# Altium schematic sheet VFD-Support-Sheet.SchDoc (part 3 of 3)
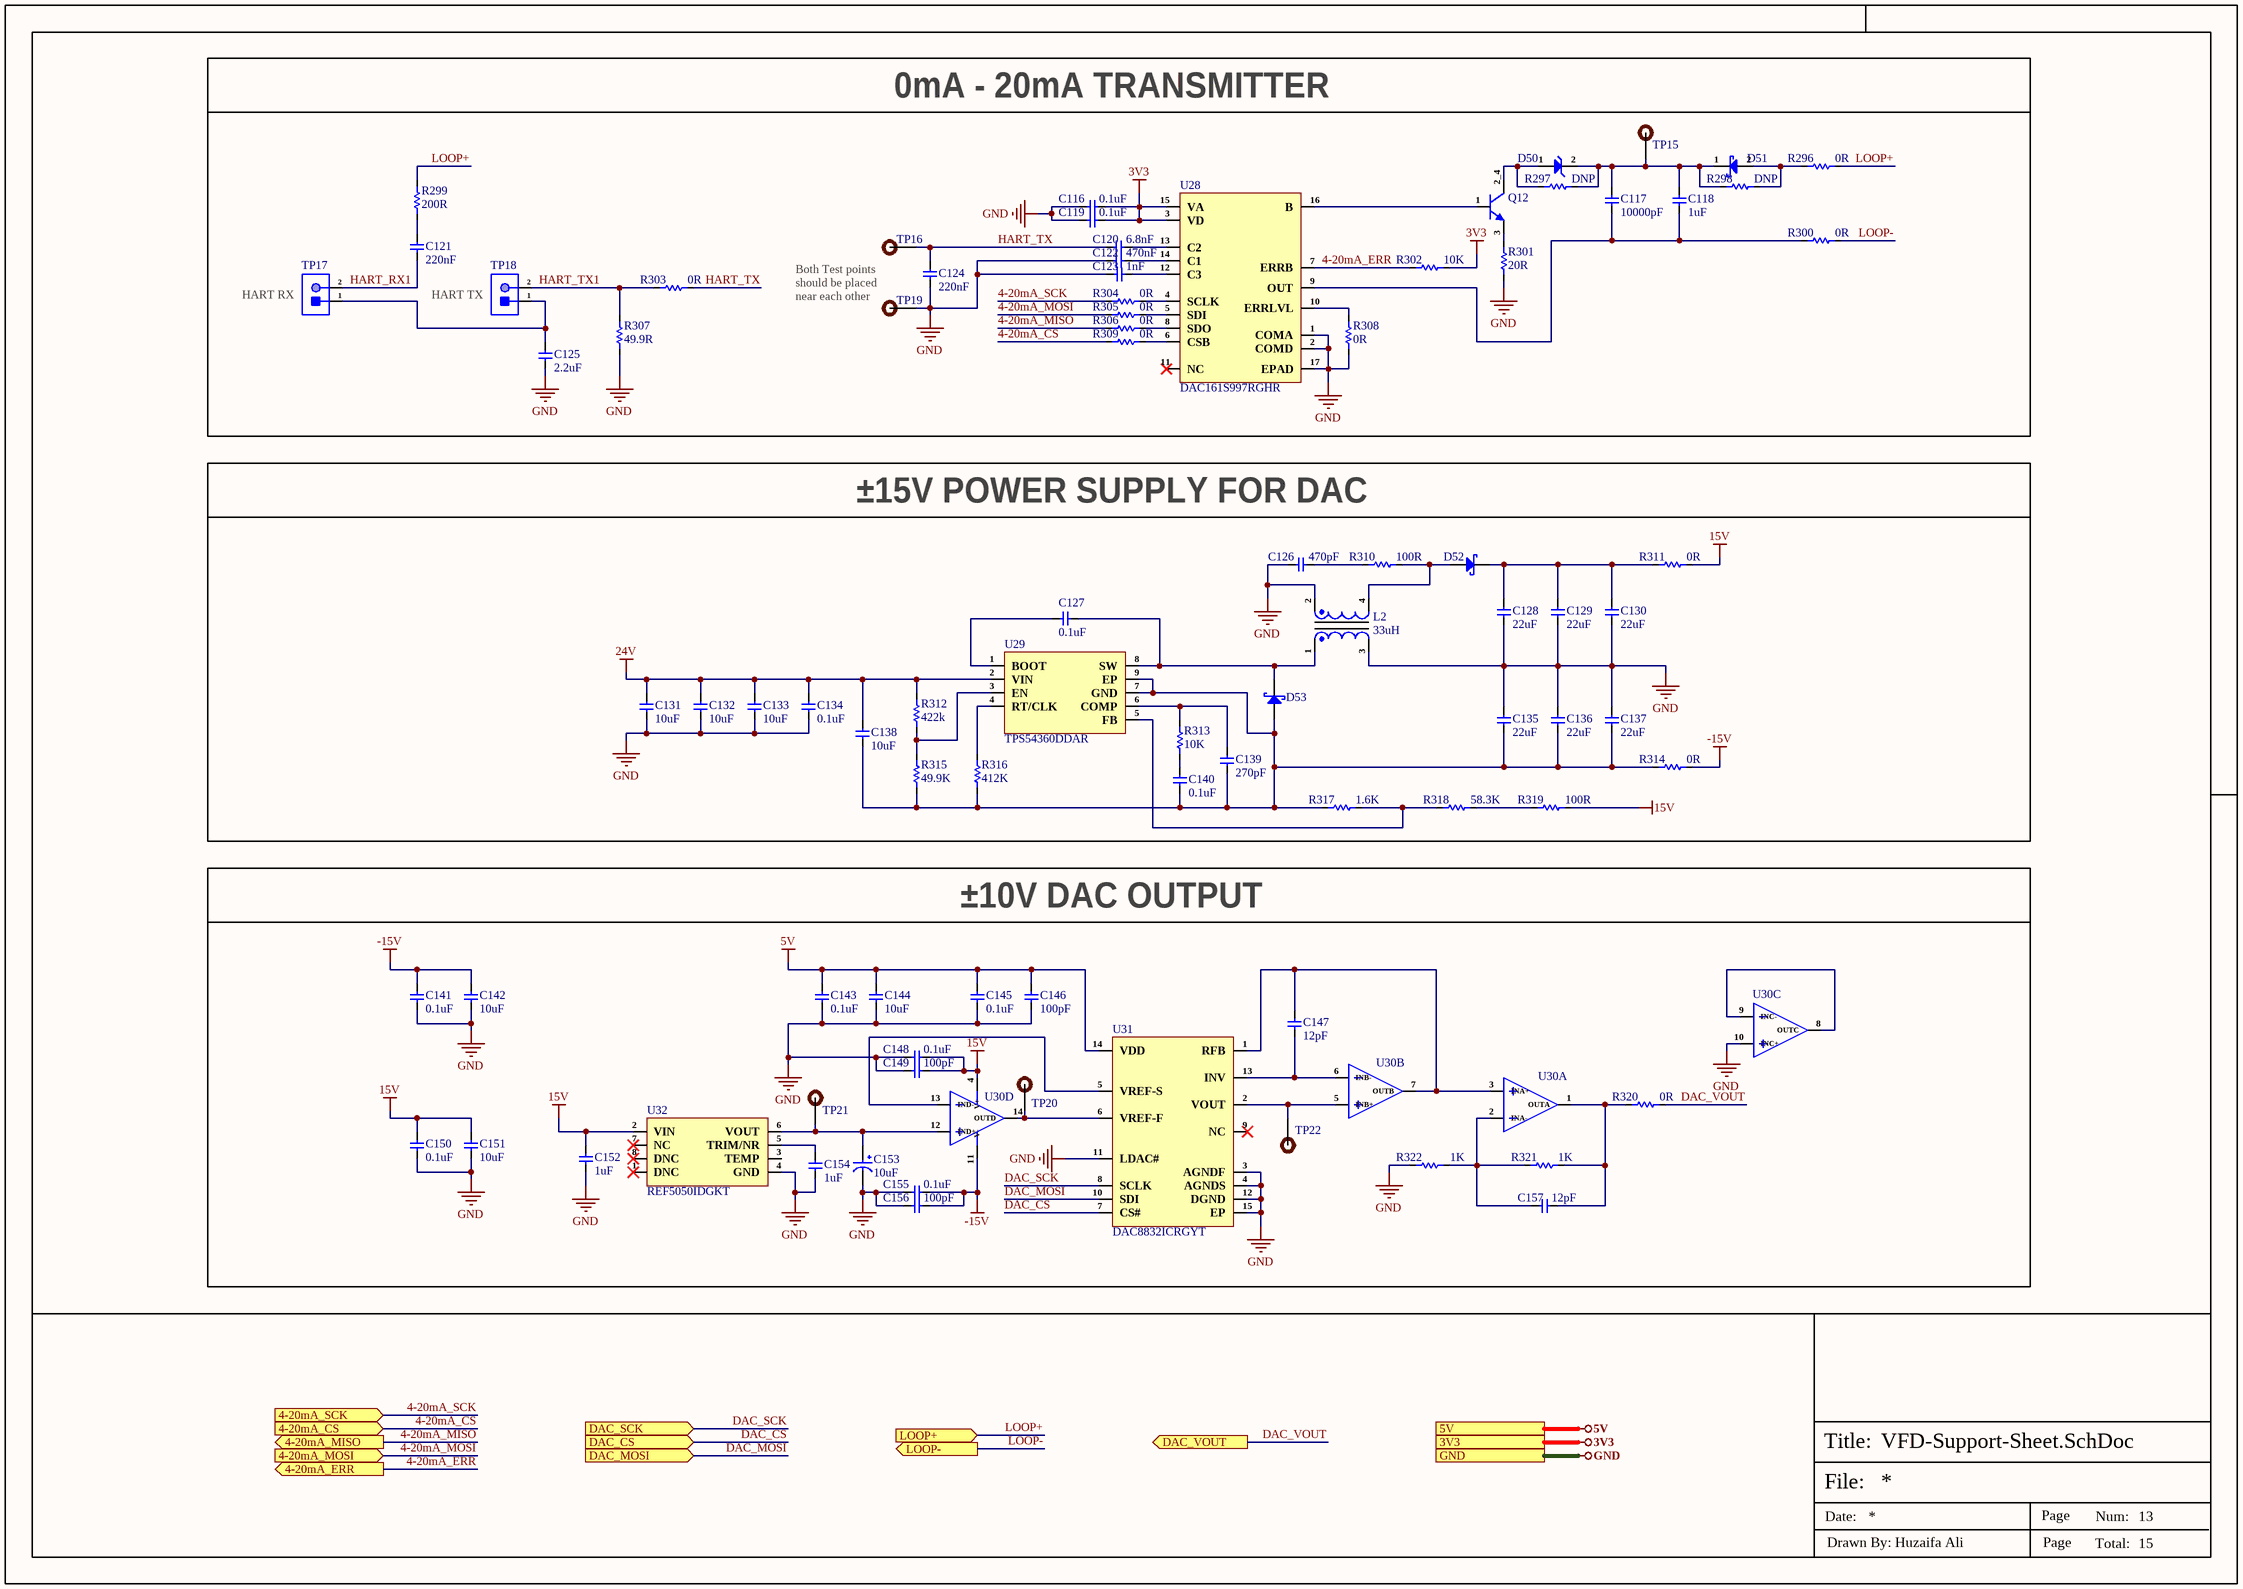
[diagram p2: VFD-Support-Sheet.SchDoc]

## Library data of the parts (continued)
R312 = RT0805BRD07422KL: RES SMD 422K OHM 0.1% 1/8W 0805; Manufacturer: Yageo; Voltage Rating: 150V; Value: 422kR; Power Rating: 125mW; Temperature Coefficient: 25ppm/°C; Item Type: Resistor; Supplier 1: Digi-Key; Manufacturer Part Number: RT0805BRD07422KL; RoHS: Yes; Category: Chip SMD Resistors; Stock 1: 2917; Pricing 1: 1=0.38, 10=0.272, 100=0.1087, 500=0.07404, 1000=0.05357, 2500=0.04963 (USD); Case/Package: 0805; Case Code (Metric): 2012; Case Code (Imperial): 0805; Min Operating Temperature: -55°C; Max Operating Temperature: 155°C; Tolerance: 0.1%; Packaging: Tape and Reel; Termination: SMD/SMT; Voltage Rating (DC): 150V; Series: RT; Max Power Dissipation: 125mW; Number of Terminations: 2; Length: 2mm; Width: 1.25mm; Height: 500um; Lead Free: Lead Free; RoHS Compliant: Yes; ComponentLink1URL: https://datasheet.ciiva.com/12704/pyu-rt-1-to-0-05-rohs-l-4-12704463.pdf?src-supplier=Mouser; ComponentLink1Description: https://datasheet.ciiva.com/12704/pyu-rt-1-to-0-05-rohs-l-4-12704463.pdf?src-supplier=Mouser; Supplier Part Number 1: YAG4899CT-ND; LCSC Part Number: C865483
R315 = RC0805FR-0749K9L: RES 49.9K OHM 1% 1/8W 0805; Manufacturer: Yageo; Item Type: Resistor; Supplier: Future Electronics; Supplier Part Number: 3813284; Manufacturer Part Number: RC0805FR-0749K9L; RoHS: Yes; Category: Chip SMD Resistors; Stock: 665000; Pricing: 5000=0.0041, 25000=0.0025, 50000=0.0038, 125000=0.0024, 200000=0.0036, 500000=0.0023, 625000=0.0035, 1250000=0.0021, 2000000=0.0032 (USD); ComponentLink1URL: https://datasheet.ciiva.com/11808/0900766b8106beab-11808911.pdf?src-supplier=Rs; ComponentLink1Description: https://datasheet.ciiva.com/11808/0900766b8106beab-11808911.pdf?src-supplier=Rs; ComponentLink2URL: https://datasheet.ciiva.com/12656/rc0805-12656764.pdf?src-supplier=Mouser; ComponentLink2Description: https://datasheet.ciiva.com/12656/rc0805-12656764.pdf?src-supplier=Mouser; ComponentLink3URL: https://datasheet.ciiva.com/2456/pyu-r-int-thick-7-2456990.pdf?src-supplier=Digi-Key; ComponentLink3Description: https://datasheet.ciiva.com/2456/pyu-r-int-thick-7-2456990.pdf?src-supplier=Digi-Key; ComponentLink4URL: https://datasheet.ciiva.com/2456/pyu-r-int-thick-7-2456991.pdf?src-supplier=Digi-Key; ComponentLink4Description: https://datasheet.ciiva.com/2456/pyu-r-int-thick-7-2456991.pdf?src-supplier=Digi-Key; ComponentLink5URL: https://datasheet.ciiva.com/2456/pyu-r-int-thick-7-2456992.pdf?src-supplier=Digi-Key; ComponentLink5Description: https://datasheet.ciiva.com/2456/pyu-r-int-thick-7-2456992.pdf?src-supplier=Digi-Key; LCSC Part Number: C114540
R316 = RT0805BRD07412KL: RES SMD 412K OHM 0.1% 1/8W 0805; Manufacturer: Yageo; Item Type: Resistors; Value: 412kR; Power Rating: 125mW; Voltage Rating: 150V; Temperature Coefficient: 25ppm/°C; Supplier: Mouser; LCSC Part Number: C865478; Manufacturer Part Number: RT0805BRD07412KL; RoHS: Yes; Stock: 5000; Pricing: 1=0.16, 10=0.121, 50=0.095, 100=0.085, 1000=0.057, 10000=0.038 (USD); Case/Package: 0805; Case Code (Imperial): 0805; Case Code (Metric): 2012; Weight: 0.000194oz; Min Operating Temperature: -55°C; Max Operating Temperature: 155°C; Packaging: Tape and Reel; Tolerance: 0.1%; Termination: SMD/SMT; Voltage Rating (DC): 150V; Series: RT; Max Power Dissipation: 125mW; Number of Terminations: 2; Length: 2mm; Width: 1.2mm; Height: 0.5mm; Lead Free: Lead Free; RoHS Compliant: Yes; ComponentLink1URL: http://www.mouser.com/ds/2/447/yageodocoutput-1125656.pdf?src-supplier=Mouser; ComponentLink1Description: http://www.mouser.com/ds/2/447/yageodocoutput-1125656.pdf?src-supplier=Mouser; ComponentLink2URL: http://www.yageo.com/documents/recent/PYu-RT_1-to-0.01_RoHS_L_9.pdf?src-supplier=Digikey; ComponentLink2Description: http://www.yageo.com/documents/recent/PYu-RT_1-to-0.01_RoHS_L_9.pdf?src-supplier=Digikey
R317 = RT0402BRD071K6L: RES SMD 1.6K OHM 0.1% 1/16W 0402; Manufacturer: Yageo; Resistance: 1.6kR; Power Rating: 62.5mW; Voltage Rating: 50V; Temperature Coefficient: 25ppm/°C; Max Power Dissipation: 63mW; Item Type: Resistor; Supplier 1: Digi-Key; Manufacturer Part Number: RT0402BRD071K6L; RoHS: Yes; Category: Chip SMD Resistors; Stock 1: 20555; Pricing 1: 1=0.40000, 10=0.33600, 100=0.13130, 500=0.07938, 1000=0.05496, 2500=0.05038, 5000=0.04580 (USD); Case/Package: 0402; Case Code (Imperial): 0402; Case Code (Metric): 1005; Weight: 2.3E-05oz; Min Operating Temperature: -55°C; Max Operating Temperature: 125°C; Packaging: Tape and Reel; Tolerance: 0.1%; Package Quantity: 10000; Resistor Type: Thin Film; Termination: SMD/SMT; Number of Terminations: 2; Voltage Rating (DC): 50V; Series: RT; Length: 0.039inch; Width: 0.5mm; Height: 0.014inch; Lead Free: Lead Free; RoHS Compliant: Yes; ComponentLink1URL: https://datasheet.ciiva.com/2582/pyu-rt-1-to-0-05-rohs-l-5-2582211.pdf?src-supplier=Digi-Key; ComponentLink1Description: https://datasheet.ciiva.com/2582/pyu-rt-1-to-0-05-rohs-l-5-2582211.pdf?src-supplier=Digi-Key; LCSC Part Number: C852616; Supplier Part Number 1: YAG4199CT-ND
R318 = RT0402BRD0758K3L: RES SMD 58.3KOHM 0.1% 1/16W 0402; Manufacturer: Yageo; Item Type: Resistors; Supplier: Mouser; LCSC Part Number: C852851; Manufacturer Part Number: RT0402BRD0758K3L; RoHS: Yes; Stock: 10000; Pricing: 1=0.16, 10=0.121, 50=0.096, 100=0.086, 1000=0.057, 10000=0.038 (USD); ComponentLink1URL: https://datasheet.octopart.com/RT0402BRD0758K3L-Yageo-datasheet-164439670.pdf?src-supplier=Newark; ComponentLink1Description: https://datasheet.octopart.com/RT0402BRD0758K3L-Yageo-datasheet-164439670.pdf?src-supplier=Newark; ComponentLink2URL: http://www.yageo.com/documents/recent/PYu-RT_1-to-0.01_RoHS_L_9.pdf?src-supplier=Digikey; ComponentLink2Description: http://www.yageo.com/documents/recent/PYu-RT_1-to-0.01_RoHS_L_9.pdf?src-supplier=Digikey; ComponentLink3URL: https://www.yageo.com/upload/media/product/productsearch/datasheet/rchip/PYu-RT_1-to-0.01_RoHS_L_12.pdf?src-supplier=Digikey; ComponentLink3Description: https://www.yageo.com/upload/media/product/productsearch/datasheet/rchip/PYu-RT_1-to-0.01_RoHS_L_12.pdf?src-supplier=Digikey; ComponentLink4URL: https://datasheet.octopart.com/RT0402BRD0758K3L-Yageo-datasheet-166250672.pdf?src-supplier=Future+Electronics; ComponentLink4Description: https://datasheet.octopart.com/RT0402BRD0758K3L-Yageo-datasheet-166250672.pdf?src-supplier=Future+Electronics
R321 R322 = RC0402FR-071KL: RES 1K OHM 1% 1/16W 0402; Manufacturer: Yageo; Resistance: 1kR; Temperature Coefficient: 100ppm/°C; Voltage Rating (DC): 50V; Power Rating: 62.5mW; Max Power Dissipation: 63mW; Item Type: Resistor; Supplier 1: Avnet; Manufacturer Part Number: RC0402FR-071KL; RoHS: Yes; Category: Chip SMD Resistors; Stock 1: 13030000; Pricing 1: 10000=0.00085, 20000=0.00087, 40000=0.00084, 60000=0.00083, 80000=0.00079, 100000=0.00078, 1000000=0.00076 (USD); Case/Package: 0402; Number of Pins: 2; Case Code (Imperial): 0402; Case Code (Metric): 1005; Size Code: 0402; Min Operating Temperature: -55°C; Max Operating Temperature: 155°C; Resistor Type: Thick Film; Tolerance: 1%; Packaging: Tape and Reel; Voltage Rating: 50V; Termination: SMD/SMT; Features: Moisture Resistant; Series: RC; Number of Terminations: 2; Resistance Tolerance: 1%; Construction: Rectangular; Technology: THICK FILM; Length: 1mm; Width: 0.5mm; Height: 0.32mm; Depth: 0.5mm; Reach SVHC Compliant: Yes; Lead Free: Lead Free; RoHS Compliant: Yes; Military Standard: Not; ComponentLink1URL: https://datasheet.ciiva.com/11819/0900766b80c66297-11819477.pdf?src-supplier=RSComponents; ComponentLink1Description: https://datasheet.ciiva.com/11819/0900766b80c66297-11819477.pdf?src-supplier=RSComponents; ComponentLink2URL: https://datasheet.ciiva.com/7983/1018594-7983502.pdf?src-supplier=Element14; ComponentLink2Description: https://datasheet.ciiva.com/7983/1018594-7983502.pdf?src-supplier=Element14; ComponentLink3URL: https://datasheet.ciiva.com/22747/1018594-22747513.pdf?src-supplier=Element14; ComponentLink3Description: https://datasheet.ciiva.com/22747/1018594-22747513.pdf?src-supplier=Element14; ComponentLink4URL: https://datasheet.ciiva.com/12666/pyu-rc0402-51-rohs-l-6-r-12666741.pdf?src-supplier=Mouser; ComponentLink4Description: https://datasheet.ciiva.com/12666/pyu-rc0402-51-rohs-l-6-r-12666741.pdf?src-supplier=Mouser; ComponentLink5URL: https://datasheet.ciiva.com/7849/1018594-7849869.pdf?src-supplier=Element14; ComponentLink5Description: https://datasheet.ciiva.com/7849/1018594-7849869.pdf?src-supplier=Element14; ComponentLink6URL: https://datasheet.ciiva.com/7849/1018594-7849871.pdf?src-supplier=Element14; ComponentLink6Description: https://datasheet.ciiva.com/7849/1018594-7849871.pdf?src-supplier=Element14; ComponentLink7URL: https://datasheet.ciiva.com/17063/pyu-rc0402-51-rohs-l-6-r-17063193.pdf?src-supplier=Future+Electronics; ComponentLink7Description: https://datasheet.ciiva.com/17063/pyu-rc0402-51-rohs-l-6-r-17063193.pdf?src-supplier=Future+Electronics; Supplier Part Number 1: RC0402FR-071KL; LCSC Part Number: C106235
TP15 TP16 TP19-TP22 = TEST POINT: Test Point ON; Item Type: TEST POINT
TP17 TP18 = 2 Test Pad: Wire Connecting Pad; Item Type: Test Point; Manufacturer Part Number: 2 Test Pad
U28 = DAC161S997RGHR: IC DAC 16BIT 16WQFN; Manufacturer: Texas Instruments; Supplier: Mouser; LCSC Part Number: C90500; Manufacturer Part Number: DAC161S997RGHR; RoHS: Yes; Item Type: IC; Stock: 4693; Pricing: 1=5.54, 10=4.08, 50=4.08, 100=3.71, 1000=3.03, 10000=2.74 (USD); ComponentLink1URL: https://datasheet.ciiva.com/18633/dac161s997-18633093.pdf?src-supplier=Digikey; ComponentLink1Description: https://datasheet.ciiva.com/18633/dac161s997-18633093.pdf?src-supplier=Digikey; ComponentLink2URL: https://datasheet.ciiva.com/29897/dac161s997-29897307.pdf?src-supplier=Avnet; ComponentLink2Description: https://datasheet.ciiva.com/29897/dac161s997-29897307.pdf?src-supplier=Avnet
U29 = TPS54360DDAR: IC REG BCK SPLIT RAIL ADJ 8SOPWR; Manufacturer: Texas Instruments; Supplier: Mouser; LCSC Part Number: C44377; Manufacturer Part Number: TPS54360DDAR; RoHS: Yes; Item Type: IC; Stock: 2440; Pricing: 1=4.37, 10=3.05, 50=3.05, 100=2.76, 1000=2.47, 10000=2.31 (USD); ComponentLink1URL: https://datasheet.ciiva.com/12221/tps54360-109421-12221526.pdf?src-supplier=Mouser; ComponentLink1Description: https://datasheet.ciiva.com/12221/tps54360-109421-12221526.pdf?src-supplier=Mouser; ComponentLink2URL: https://datasheet.ciiva.com/14833/2976tps54360-14833745.pdf?src-supplier=Arrow+Electronics; ComponentLink2Description: https://datasheet.ciiva.com/14833/2976tps54360-14833745.pdf?src-supplier=Arrow+Electronics; ComponentLink3URL: https://datasheet.ciiva.com/14377/tps54360-14377976.pdf?src-supplier=Avnet; ComponentLink3Description: https://datasheet.ciiva.com/14377/tps54360-14377976.pdf?src-supplier=Avnet; ComponentLink4URL: https://datasheet.ciiva.com/41798/tps54360-41798794.pdf?src-supplier=Digikey; ComponentLink4Description: https://datasheet.ciiva.com/41798/tps54360-41798794.pdf?src-supplier=Digikey
U30 = OPA4192IPWR: IC OPAMP GP 4 CIRCUIT 14TSSOP; Manufacturer: Texas Instruments; Supplier: Mouser; LCSC Part Number: C2057935; Manufacturer Part Number: OPA4192IPWR; RoHS: Yes; Item Type: IC; Stock: 4607; Pricing: 1=6.33, 10=4.87, 50=4.5, 100=4.1, 1000=3.67, 10000=3.59 (USD); ComponentLink1URL: http://www.ti.com/general/docs/suppproductinfo.tsp?distId=10&amp;gotoUrl=http%3A%2F%2Fwww.ti.com%2Flit%2Fgpn%2Fopa4192&src-supplier=Digikey; ComponentLink1Description: http://www.ti.com/general/docs/suppproductinfo.tsp?distId=10&amp;gotoUrl=http%3A%2F%2Fwww.ti.com%2Flit%2Fgpn%2Fopa4192&src-supplier=Digikey; ComponentLink2URL: http://www.ti.com/lit/gpn/opa4192?src-supplier=Mouser; ComponentLink2Description: http://www.ti.com/lit/gpn/opa4192?src-supplier=Mouser
U31 = DAC8832ICRGYT: IC DAC 16BIT V-OUT 14VQFN; Manufacturer: Texas Instruments; Supplier: Mouser; LCSC Part Number: C2876764; Manufacturer Part Number: DAC8832ICRGYT; RoHS: Yes; Item Type: IC; Stock: 307; Pricing: 1=16.19, 10=12.83, 50=11.99, 100=11.06, 1000=10.23, 10000=10.23 (USD); ComponentLink1URL: https://datasheet.ciiva.com/12285/sbas380b-190797-12285552.pdf?src-supplier=Mouser; ComponentLink1Description: https://datasheet.ciiva.com/12285/sbas380b-190797-12285552.pdf?src-supplier=Mouser; ComponentLink2URL: https://datasheet.ciiva.com/15147/getdatasheetpartid-247745-15147072.pdf?src-supplier=Verical; ComponentLink2Description: https://datasheet.ciiva.com/15147/getdatasheetpartid-247745-15147072.pdf?src-supplier=Verical; ComponentLink3URL: https://datasheet.ciiva.com/41460/001186155-da-01-en-ic-dac-16bit-vo-dac8832icrgyt-qfn-14-tid-41460090.pdf?src-supplier=Conrad; ComponentLink3Description: https://datasheet.ciiva.com/41460/001186155-da-01-en-ic-dac-16bit-vo-dac8832icrgyt-qfn-14-tid-41460090.pdf?src-supplier=Conrad; ComponentLink4URL: https://datasheet.ciiva.com/14254/sbas380b-14254541.pdf?src-supplier=Avnet; ComponentLink4Description: https://datasheet.ciiva.com/14254/sbas380b-14254541.pdf?src-supplier=Avnet; ComponentLink5URL: https://datasheet.ciiva.com/1364/dac8832-1364376.pdf?src-supplier=Digikey; ComponentLink5Description: https://datasheet.ciiva.com/1364/dac8832-1364376.pdf?src-supplier=Digikey; ComponentLink6URL: https://datasheet.ciiva.com/1364/dac8832-1364377.pdf?src-supplier=Digikey; ComponentLink6Description: https://datasheet.ciiva.com/1364/dac8832-1364377.pdf?src-supplier=Digikey; ComponentLink7URL: https://datasheet.ciiva.com/1364/dac8832-1364378.pdf?src-supplier=Digikey; ComponentLink7Description: https://datasheet.ciiva.com/1364/dac8832-1364378.pdf?src-supplier=Digikey
U32 = REF5050IDGKT: IC VREF SERIES 0.05% 8VSSOP; Manufacturer: Texas Instruments; Supplier: Mouser; LCSC Part Number: C2156540; Manufacturer Part Number: REF5050IDGKT; RoHS: Yes; Item Type: IC; Stock: 701; Pricing: 1=7.97, 10=6.18, 50=5.73, 100=5.23, 1000=4.86, 10000=4.86 (USD); ComponentLink1URL: https://datasheet.ciiva.com/22666/1885920-22666106.pdf?src-supplier=Element14; ComponentLink1Description: https://datasheet.ciiva.com/22666/1885920-22666106.pdf?src-supplier=Element14; ComponentLink2URL: https://datasheet.ciiva.com/2007/ref5020-2007552.pdf?src-supplier=Digikey; ComponentLink2Description: https://datasheet.ciiva.com/2007/ref5020-2007552.pdf?src-supplier=Digikey; ComponentLink3URL: https://datasheet.ciiva.com/2007/ref5020-2007553.pdf?src-supplier=Digikey; ComponentLink3Description: https://datasheet.ciiva.com/2007/ref5020-2007553.pdf?src-supplier=Digikey; ComponentLink4URL: https://datasheet.ciiva.com/2007/ref5020-2007554.pdf?src-supplier=Digikey; ComponentLink4Description: https://datasheet.ciiva.com/2007/ref5020-2007554.pdf?src-supplier=Digikey; ComponentLink5URL: https://datasheet.ciiva.com/14197/ref5050-14197087.pdf?src-supplier=Avnet; ComponentLink5Description: https://datasheet.ciiva.com/14197/ref5050-14197087.pdf?src-supplier=Avnet